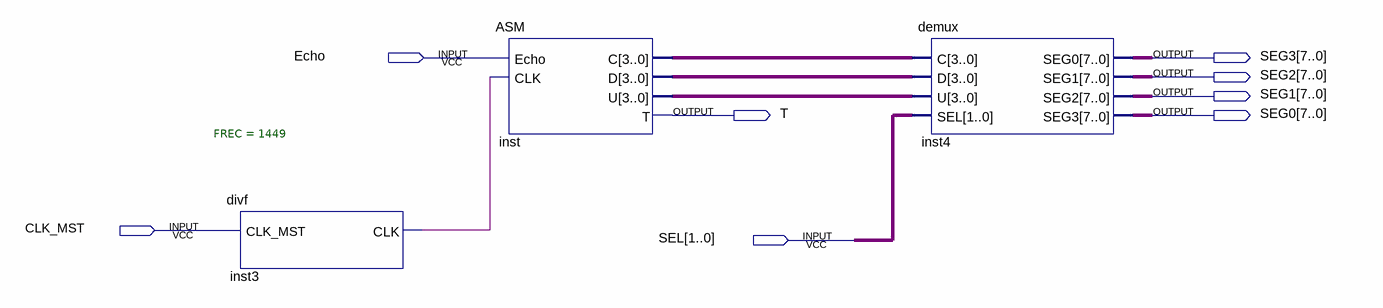
[diagram p0: schematic sheet]
// Quartus schematic Practica7.bdf as structural Verilog: 3 symbols, 8 pins
module Practica7 (
  input  Echo,
  input  CLK_MST,
  input  [1:0] SEL,
  output [7:0] SEG3,
  output [7:0] SEG2,
  output [7:0] SEG1,
  output T,
  output [7:0] SEG0
);

  wire inst3_clk;
  wire [3:0] inst_c, inst_d, inst_u;

  divf #(.FREC(1449)) inst3 (.CLK_MST(CLK_MST), .CLK(inst3_clk));
  ASM inst (.Echo(Echo), .CLK(inst3_clk), .C(inst_c), .D(inst_d), .U(inst_u), .T(T));
  demux inst4 (.C(inst_c), .D(inst_d), .U(inst_u), .SEL(SEL), .SEG0(SEG3), .SEG1(SEG2), .SEG2(SEG1), .SEG3(SEG0));
endmodule
